# Altium schematic sheet Power_Section.SchDoc
size 420 x 297 mm; DocumentNumber: 2; SheetNumber: 2; SheetTotal: 17
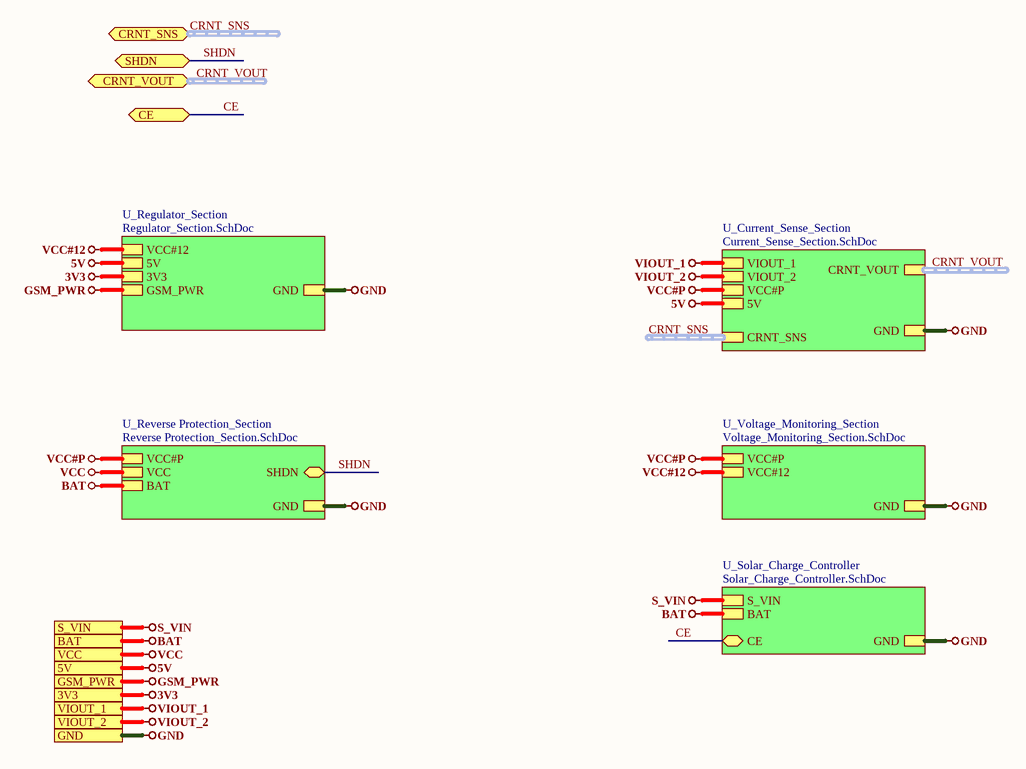
[diagram p0: Power_Section.SchDoc]

## Sub-sheets
U_Current_Sense_Section = Current_Sense_Section.SchDoc: CRNT_SNS (harness CRNT_SNS), VIOUT_1, 5V, VIOUT_2, GND, VCC#P, CRNT_VOUT (harness CRNT_VOUT)
U_Regulator_Section = Regulator_Section.SchDoc: 5V, 3V3, GND, VCC#12, GSM_PWR
U_Reverse Protection_Section = Reverse Protection_Section.SchDoc: SHDN (bidir), VCC#P, GND, VCC, BAT
U_Solar_Charge_Controller = Solar_Charge_Controller.SchDoc: S_VIN, BAT, GND, CE (bidir)
U_Voltage_Monitoring_Section = Voltage_Monitoring_Section.SchDoc: VCC#P, GND, VCC#12

## Ports
3V3, 5V, BAT, CE (bidir), CRNT_SNS (bidir, harness CRNT_SNS), CRNT_VOUT (bidir, harness CRNT_VOUT), GND, GSM_PWR, S_VIN, SHDN (bidir), VCC, VIOUT_1, VIOUT_2

## Nets
3V3: port 3V3, sheet U_Regulator_Section/3V3
5V: port 5V, sheet U_Current_Sense_Section/5V, sheet U_Regulator_Section/5V
BAT: port BAT, sheet U_Reverse Protection_Section/BAT, sheet U_Solar_Charge_Controller/BAT
GND: port GND, sheet U_Current_Sense_Section/GND, sheet U_Voltage_Monitoring_Section/GND, sheet U_Regulator_Section/GND, sheet U_Reverse Protection_Section/GND, sheet U_Solar_Charge_Controller/GND
GSM_PWR: port GSM_PWR, sheet U_Regulator_Section/GSM_PWR
S_VIN: port S_VIN, sheet U_Solar_Charge_Controller/S_VIN
VCC: port VCC, sheet U_Reverse Protection_Section/VCC
VCC#12: sheet U_Voltage_Monitoring_Section/VCC#12, sheet U_Regulator_Section/VCC#12
VCC#P: sheet U_Current_Sense_Section/VCC#P, sheet U_Voltage_Monitoring_Section/VCC#P, sheet U_Reverse Protection_Section/VCC#P
VIOUT_1: port VIOUT_1, sheet U_Current_Sense_Section/VIOUT_1
VIOUT_2: port VIOUT_2, sheet U_Current_Sense_Section/VIOUT_2
CE: port CE, sheet U_Solar_Charge_Controller/CE
SHDN: port SHDN, sheet U_Reverse Protection_Section/SHDN

## Buses and harness runs
harness CRNT_SNS = port CRNT_SNS
harness CRNT_SNS = sheet U_Current_Sense_Section/CRNT_SNS
harness CRNT_VOUT = port CRNT_VOUT
harness CRNT_VOUT = sheet U_Current_Sense_Section/CRNT_VOUT

## Notes on the sheet
- File:
- Title:
- Date:
- Page
- Num:
- Total:
- Drawn By: Huzaifa Ali